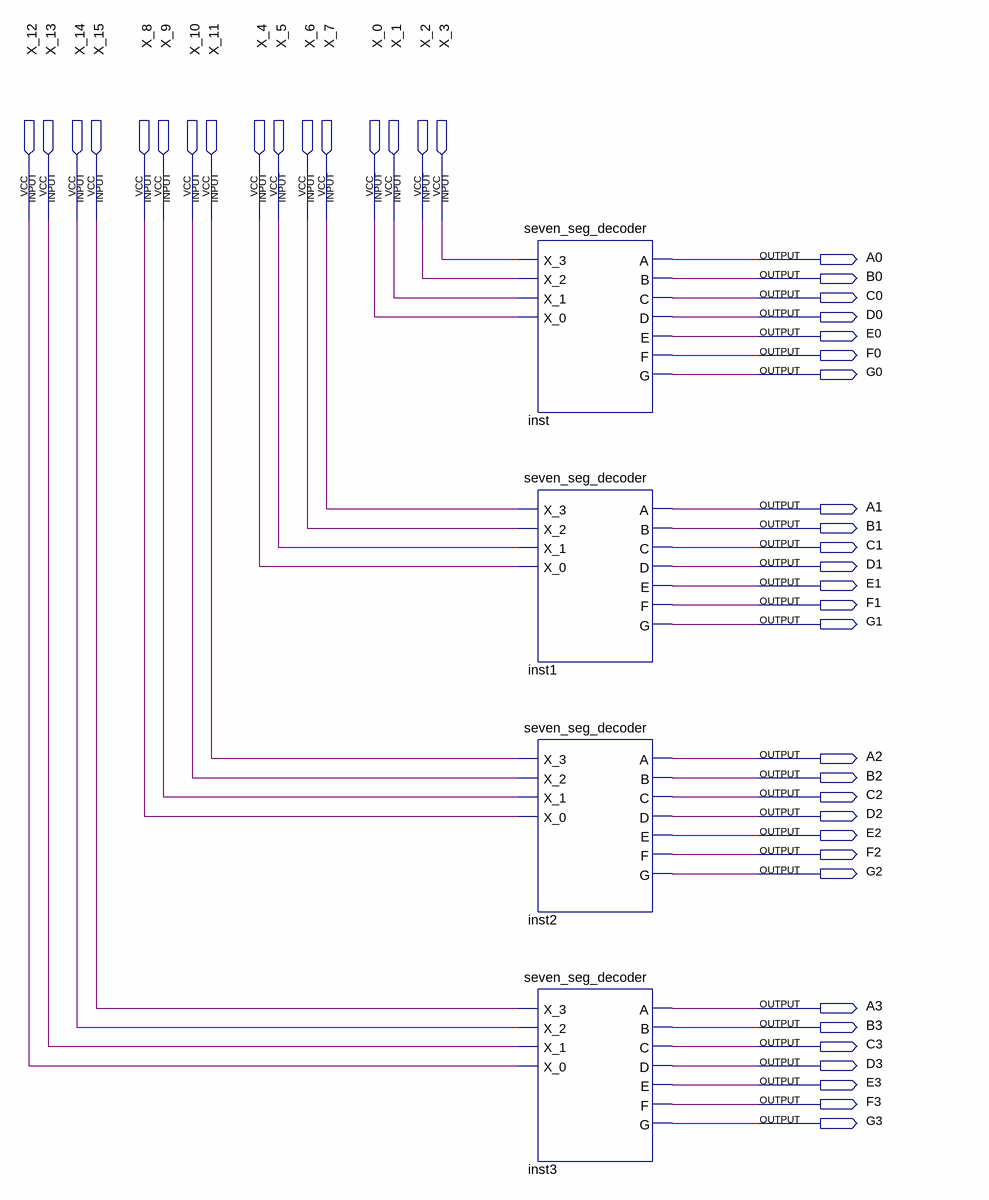
[diagram p0: schematic sheet]
// Quartus schematic lab5step1.bdf as structural Verilog: 4 symbols, 44 pins
module lab5step1 (
  input  X_12,
  input  X_13,
  input  X_14,
  input  X_15,
  input  X_8,
  input  X_9,
  input  X_10,
  input  X_11,
  input  X_4,
  input  X_5,
  input  X_6,
  input  X_7,
  input  X_0,
  input  X_1,
  input  X_2,
  input  X_3,
  output A0,
  output B0,
  output C0,
  output D0,
  output E0,
  output F0,
  output G0,
  output A1,
  output B1,
  output C1,
  output D1,
  output E1,
  output F1,
  output G1,
  output A2,
  output B2,
  output C2,
  output D2,
  output E2,
  output F2,
  output G2,
  output A3,
  output B3,
  output C3,
  output D3,
  output E3,
  output F3,
  output G3
);

  seven_seg_decoder inst (
    .X_3(X_3), .X_2(X_2), .X_1(X_1), .X_0(X_0), .A(A0), .B(B0), .C(C0), .D(D0), .E(E0), .F(F0), .G(G0));
  seven_seg_decoder inst1 (
    .X_3(X_7), .X_2(X_6), .X_1(X_5), .X_0(X_4), .A(A1), .B(B1), .C(C1), .D(D1), .E(E1), .F(F1), .G(G1));
  seven_seg_decoder inst2 (
    .X_3(X_11), .X_2(X_10), .X_1(X_9), .X_0(X_8), .A(A2), .B(B2), .C(C2), .D(D2), .E(E2), .F(F2), .G(G2));
  seven_seg_decoder inst3 (
    .X_3(X_15), .X_2(X_14), .X_1(X_13), .X_0(X_12), .A(A3), .B(B3), .C(C3), .D(D3), .E(E3), .F(F3), .G(G3));
endmodule
